# Altium schematic sheet CONNECTORS.SchDoc
size A4; SheetNumber: 15; SheetTotal: 20
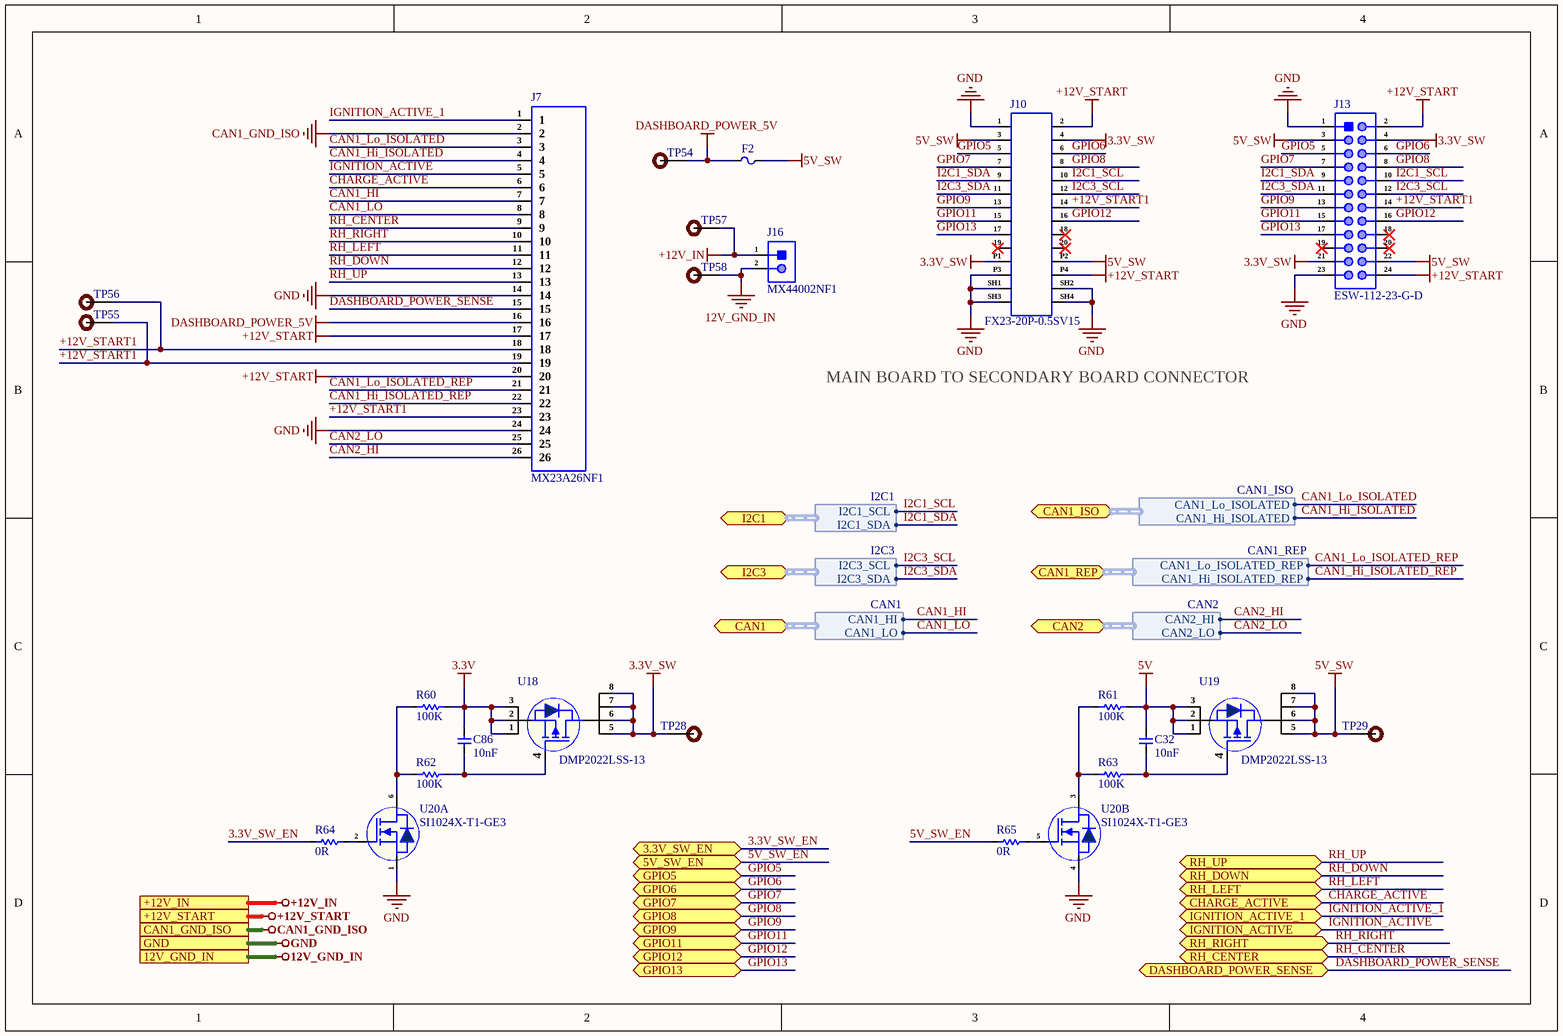
[diagram p0: CONNECTORS.SchDoc]

## Parts
C32  10nF  [Cap-0402]
C86  10nF  [Cap-0402]
F2  0458001.DR  [0458001.DR]  (value not drawn)
J7  MX23A26NF1  [MX23A26NF1]
J10  FX23-20P-0.5SV15  [FX23-20P-0.5SV15]
J13  ESW-112-23-G-D  [ESW-112-23-G-D]
J16  MX44002NF1  [MX44002NF1]
R60  100K  [Res-0402]
R61  100K  [Res-0402]
R62  100K  [Res-0402]
R63  100K  [Res-0402]
R64  0R  [Res-0402]
R65  0R  [Res-0402]
TP28  DNP  [Test-point]  (value not drawn)
TP29  DNP  [Test-point]  (value not drawn)
TP54  DNP  [Test-point]  (value not drawn)
TP55  DNP  [Test-point]  (value not drawn)
TP56  DNP  [Test-point]  (value not drawn)
TP57  DNP  [Test-point]  (value not drawn)
TP58  DNP  [Test-point]  (value not drawn)
U18  DMP2022LSS-13  [SOIC-8]
U19  DMP2022LSS-13  [SOIC-8]
U20  SI1024X-T1-GE3  [SC-89]  (parts A,B of 2)

## Ports
3.3V_SW_EN (bidir, see Top_Sheet[3D], I2C_INTERFACE[2B]), 5V_SW_EN (bidir, see Top_Sheet[3D], I2C_INTERFACE[2B]), 12V_GND_IN (see Top_Sheet[3C], INPUT_SUPPLY_PROTECTION[1D]), +12V_IN (see Top_Sheet[4C], INPUT_SUPPLY_PROTECTION[1C]), +12V_START (see Top_Sheet[4C], DC_DC_CONVERTER[1D], DIGITAL_I-O_O-P[1D], INPUT_SUPPLY_PROTECTION[1C]), CAN1 (bidir, harness CAN1, see Top_Sheet[4C], 03-CAN2_SPI_CAN_CONTROLLER[3D]), CAN1_GND_ISO (see Top_Sheet[3C], 03-CAN2_SPI_CAN_CONTROLLER[1D]), CAN1_ISO (bidir, harness CAN1_ISO, see Top_Sheet[4C], 03-CAN2_SPI_CAN_CONTROLLER[3C]), CAN1_REP (bidir, harness CAN1_REP, see Top_Sheet[4C], 03-CAN2_SPI_CAN_CONTROLLER[3D]), CAN2 (bidir, harness CAN2, see Top_Sheet[4D], CAN2_SPI_CAN_CONTROLLER[2D]), CHARGE_ACTIVE (bidir, see Top_Sheet[3D], I2C_INTERFACE[2B]), DASHBOARD_POWER_SENSE (bidir, see Top_Sheet[3D], DIGITAL_I-O_O-P[1D], GPIO_NC_INTERFACE[3D]), GND (see Top_Sheet[3C], 03-CAN2_SPI_CAN_CONTROLLER[1D], APALIS_POWER_SUPPLY[1D], CAN2_SPI_CAN_CONTROLLER[1D], CODEC_INTERFACE[1D], DC_DC_CONVERTER[1D], DIGITAL_I-O_O-P[1D], ETHERNET_INTERFACE[1D], FUTURE_USE_CONNECTOR[1D], GPIO_NC_INTERFACE[4B], HDMI_INTERFACE[1D], I2C_INTERFACE[1B], INPUT_SUPPLY_PROTECTION[1D], LTE_MODULE[1D], MECHANICAL_FOR_PCB[1D], MICRO_SD_CARD_INTERFACE[1D], Reset_and_SDIO[1D], UART_INTERFACE[1D], USB3.0_INTERFACE[1D]), GPIO5 (bidir, see Top_Sheet[3C], FUTURE_USE_CONNECTOR[2C]), GPIO6 (bidir, see Top_Sheet[3C], FUTURE_USE_CONNECTOR[2C]), GPIO7 (bidir, see Top_Sheet[3C], FUTURE_USE_CONNECTOR[2C]), GPIO8 (bidir, see Top_Sheet[3C], FUTURE_USE_CONNECTOR[2D]), GPIO9 (bidir, see Top_Sheet[3C], FUTURE_USE_CONNECTOR[3C], GPIO_NC_INTERFACE[1D]), GPIO11 (bidir, see Top_Sheet[3C], FUTURE_USE_CONNECTOR[3C], GPIO_NC_INTERFACE[3B]), GPIO12 (bidir, see Top_Sheet[3C], FUTURE_USE_CONNECTOR[3C], GPIO_NC_INTERFACE[3B]), GPIO13 (bidir, see Top_Sheet[3C], FUTURE_USE_CONNECTOR[3C], GPIO_NC_INTERFACE[3B]), I2C1 (bidir, harness I2C1, see Top_Sheet[3D], FUTURE_USE_CONNECTOR[2D], I2C_INTERFACE[4B]), I2C3 (bidir, harness I2C3, see Top_Sheet[3C], CODEC_INTERFACE[3D], I2C_INTERFACE[4B]), IGNITION_ACTIVE (bidir, see Top_Sheet[4D], DIGITAL_I-O_O-P[1D]), IGNITION_ACTIVE_1 (bidir, see Top_Sheet[3D], I2C_INTERFACE[2B]), RH_CENTER (bidir, see Top_Sheet[4C], DIGITAL_I-O_O-P[1D]), RH_DOWN (bidir, see Top_Sheet[4C], DIGITAL_I-O_O-P[1C]), RH_LEFT (bidir, see Top_Sheet[4C], DIGITAL_I-O_O-P[1C]), RH_RIGHT (bidir, see Top_Sheet[4C], DIGITAL_I-O_O-P[1C]), RH_UP (bidir, see Top_Sheet[4C], DIGITAL_I-O_O-P[1C])

## Harnesses
CAN1_ISO: CAN1_Lo_ISOLATED, CAN1_Hi_ISOLATED
CAN1_REP: CAN1_Lo_ISOLATED_REP, CAN1_Hi_ISOLATED_REP
CAN1: CAN1_HI, CAN1_LO
I2C1: I2C1_SCL, I2C1_SDA
I2C3: I2C3_SCL, I2C3_SDA
CAN2: CAN2_HI, CAN2_LO

## Nets
3.3V: C86.2 R60.2 U18.1(S) U18.2(S) U18.3(S)
3.3V_SW: J10.4 J10.P1 J13.4 J13.21 TP28.1 U18.5(D) U18.6(D) U18.7(D) U18.8(D)
5V: C32.2 R61.2 U19.1(S) U19.2(S) U19.3(S)
5V_SW: F2.2 J10.3 J10.P2 J13.3 J13.22 TP29.1 U19.5(D) U19.6(D) U19.7(D) U19.8(D)
12V_GND_IN: J16.2 TP58.1 ; port 12V_GND_IN
+12V_IN: J16.1 TP57.1 ; port +12V_IN
+12V_START: J7.17 J7.20 J10.2 J10.P4 J13.2 J13.24 ; port +12V_START
CAN1_GND_ISO: J7.2 ; port CAN1_GND_ISO
DASHBOARD_POWER_5V: F2.1 J7.16 TP54.1
GND: J7.14 J7.24 J10.1 J10.P3 J10.SH1 J10.SH2 J10.SH3 J10.SH4 J13.1 J13.23 U20.1(S1) U20.4(S2) ; port GND
3.3V_SW_EN: R64.1 ; port 3.3V_SW_EN
5V_SW_EN: R65.1 ; port 5V_SW_EN
+12V_START1: J7.18 J7.19 J7.23 J10.14 J13.14 TP55.1 TP56.1
CAN1_HI: J7.7 ; port CAN1.CAN1_HI
CAN1_Hi_ISOLATED: J7.4 ; port CAN1_ISO.CAN1_Hi_ISOLATED
CAN1_Hi_ISOLATED_REP: J7.22 ; port CAN1_REP.CAN1_Hi_ISOLATED_REP
CAN1_LO: J7.8 ; port CAN1.CAN1_LO
CAN1_Lo_ISOLATED: J7.3 ; port CAN1_ISO.CAN1_Lo_ISOLATED
CAN1_Lo_ISOLATED_REP: J7.21 ; port CAN1_REP.CAN1_Lo_ISOLATED_REP
CAN2_HI: J7.26 ; port CAN2.CAN2_HI
CAN2_LO: J7.25 ; port CAN2.CAN2_LO
CHARGE_ACTIVE: J7.6 ; port CHARGE_ACTIVE
DASHBOARD_POWER_SENSE: J7.15 ; port DASHBOARD_POWER_SENSE
GPIO5: J10.5 J13.5 ; port GPIO5
GPIO6: J10.6 J13.6 ; port GPIO6
GPIO7: J10.7 J13.7 ; port GPIO7
GPIO8: J10.8 J13.8 ; port GPIO8
GPIO9: J10.13 J13.13 ; port GPIO9
GPIO11: J10.15 J13.15 ; port GPIO11
GPIO12: J10.16 J13.16 ; port GPIO12
GPIO13: J10.17 J13.17 ; port GPIO13
I2C1_SCL: J10.10 J13.10 ; port I2C1.I2C1_SCL
I2C1_SDA: J10.9 J13.9 ; port I2C1.I2C1_SDA
I2C3_SCL: J10.12 J13.12 ; port I2C3.I2C3_SCL
I2C3_SDA: J10.11 J13.11 ; port I2C3.I2C3_SDA
IGNITION_ACTIVE: J7.5 ; port IGNITION_ACTIVE
IGNITION_ACTIVE_1: J7.1 ; port IGNITION_ACTIVE_1
RH_CENTER: J7.9 ; port RH_CENTER
RH_DOWN: J7.12 ; port RH_DOWN
RH_LEFT: J7.11 ; port RH_LEFT
RH_RIGHT: J7.10 ; port RH_RIGHT
RH_UP: J7.13 ; port RH_UP
NetC32_1: C32.1 R63.2 U19.4(G)
NetC86_1: C86.1 R62.2 U18.4(G)
NetR60_1: R60.1 R62.1 U20.6(D1)
NetR61_1: R61.1 R63.1 U20.3(D2)
NetR64_2: R64.2 U20.2(G1)
NetR65_2: R65.2 U20.5(G2)

Not connected (* = marked no-connect by the designer): J10 18* 19* 20*; J13 18* 19* 20*

## Notes on the sheet
- MAIN BOARD TO SECONDARY BOARD CONNECTOR

## Library data of the parts
C32 C86 = C0402C103K5RAC7411: CAP CER 10000PF 50V X7R 0402; Manufacturer: KEMET; Dielectric Material: Ceramic; Tolerance: 10%; Item Type: Capacitor; Supplier: Mouser; Supplier Part Number: 80-C0402C103K5R7411; Manufacturer Part Number: C0402C103K5RAC7411; RoHS: Yes; Category: Ceramic Capacitors; Stock: 440672; Pricing: 1=0.1, 10=0.017, 50=0.017, 100=0.009, 1000=0.005, 10000=0.004 (USD); Mounting Technology: Surface Mount; Case/Package: 0402; Min Operating Temperature: -55°C; Max Operating Temperature: 125°C; Value: 10nF; Dielectric: X7R; Voltage Rating (DC): 50V; Construction: Flat; Length: 1mm; Height: 0.5mm; Depth: 0.5mm; Radiation Hardening: No; RoHS Compliant: Yes; ComponentLink1URL: http://capacitoredge.kemet.com/capedge2/DataSheet?pn=C0402C103K5RAC7411&src-supplier=Avnet; ComponentLink1Description: http://capacitoredge.kemet.com/capedge2/DataSheet?pn=C0402C103K5RAC7411&src-supplier=Avnet
F2 = 0458001.DR: FUSE BRD MNT 1A 48VAC 75VDC 1206; Manufacturer: Littelfuse; Supplier: Rs; Supplier Part Number: 1740295; Manufacturer Part Number: 0458001.DR; RoHS: Yes; Category: Fuses; Stock: 140; Pricing: 1=0.76003, 10=0.73892, 25=0.71895, 50=0.70003 (GBP); ComponentLink1URL: https://datasheet.ciiva.com/299/littelfuse-fuse-458-series-299789.pdf?src-supplier=Digi-Key; ComponentLink1Description: https://datasheet.ciiva.com/299/littelfuse-fuse-458-series-299789.pdf?src-supplier=Digi-Key; ComponentLink2URL: https://datasheet.ciiva.com/299/littelfuse-fuse-458-series-299790.pdf?src-supplier=Digi-Key; ComponentLink2Description: https://datasheet.ciiva.com/299/littelfuse-fuse-458-series-299790.pdf?src-supplier=Digi-Key; ComponentLink3URL: https://datasheet.ciiva.com/299/littelfuse-fuse-458-series-299791.pdf?src-supplier=Digi-Key; ComponentLink3Description: https://datasheet.ciiva.com/299/littelfuse-fuse-458-series-299791.pdf?src-supplier=Digi-Key; ComponentLink4URL: https://datasheet.ciiva.com/1730/337915-1730543.pdf?src-supplier=Newark; ComponentLink4Description: https://datasheet.ciiva.com/1730/337915-1730543.pdf?src-supplier=Newark; ComponentLink5URL: https://datasheet.ciiva.com/7991/337915-7991902.pdf?src-supplier=Element14; ComponentLink5Description: https://datasheet.ciiva.com/7991/337915-7991902.pdf?src-supplier=Element14; ComponentLink6URL: https://datasheet.ciiva.com/1549/337915-1549634.pdf?src-supplier=Element14; ComponentLink6Description: https://datasheet.ciiva.com/1549/337915-1549634.pdf?src-supplier=Element14; Item Type: Fuse
J7 = MX23A26NF1: CONN HEADER R/A 26POS 2.5MM; Manufacturer: JAE Electronics; Current Rating: 3A; Gender: Male; Connector Type: Header,Power,Rectangular; Number of Positions: 26; Insulation Resistance: 100MR; Wire Gauge (Max): 16AWG; Wire Gauge (Min): 22AWG; Outside Diameter: 2.2mm; Ratings: Waterproof; Supplier: Rs; Supplier Part Number: 435774; Manufacturer Part Number: MX23A26NF1; RoHS: Yes; Category: Automotive Connectors; Stock: 42; Pricing: 1=7.15, 10=6.83, 20=6.5 (GBP); Mounting Technology: Through Hole; Contact Material: Copper Alloy,Brass,Copper; Contact Plating: Tin; Color: Black; Material: PBT,Polybutylene; Contact Shape: Square; Contact Finish - Mating: TIN; Insulation Material: PBT; Insulation Color: Black; Min Operating Temperature: -40°C; Max Operating Temperature: 125°C; Number of Rows: 2; Packaging: Bulk; Package Quantity: 160; Termination: Solder; Number of Contacts: 26; Orientation: Right Angle; Features: WATERPROOF; Series: MX23A; Contact Type: Male Pin; Fastening Type: Latch; Length: 44mm; Pitch: 2.5mm; Reach SVHC Compliant: No; RoHS Compliant: Yes; ComponentLink1URL: https://datasheet.ciiva.com/11748/0900766b80fc1621-11748856.pdf?src-supplier=Rs; ComponentLink1Description: https://datasheet.ciiva.com/11748/0900766b80fc1621-11748856.pdf?src-supplier=Rs; ComponentLink2URL: https://datasheet.ciiva.com/7621/611555-7621573.pdf?src-supplier=Element14; ComponentLink2Description: https://datasheet.ciiva.com/7621/611555-7621573.pdf?src-supplier=Element14; ComponentLink3URL: https://datasheet.ciiva.com/726/transportation-pg-v2-2-726957.pdf?src-supplier=Digi-Key; ComponentLink3Description: https://datasheet.ciiva.com/726/transportation-pg-v2-2-726957.pdf?src-supplier=Digi-Key
J10 = FX23-20P-0.5SV15: CONN HDR 20POS SMD GOLD; Manufacturer: Hirose; Supplier: Future Electronics; Supplier Part Number: 4093766; Manufacturer Part Number: FX23-20P-0.5SV15; RoHS: Yes; Category: Board to Board Connectors; Stock: 1092; Pricing: 84=2.41, 168=2.36, 252=2.34, 420=2.31, 840=2.25 (USD); ComponentLink1URL: https://www.hirose.com/product/en/download_file/key_name/FX23-20P-0.5SV15/category/Specification%20Sheet/doc_file_id/88145/?file_category_id=9&item_id=05733001000&is_series=&src-supplier=Digi-Key; ComponentLink1Description: https://www.hirose.com/product/en/download_file/key_name/FX23-20P-0.5SV15/category/Specification%20Sheet/doc_file_id/88145/?file_category_id=9&item_id=05733001000&is_series=&src-supplier=Digi-Key; ComponentLink2URL: https://datasheet.octopart.com/FX23-20P-0.5SV15-Hirose-datasheet-155938459.pdf?src-supplier=Sager+Electronics; ComponentLink2Description: https://datasheet.octopart.com/FX23-20P-0.5SV15-Hirose-datasheet-155938459.pdf?src-supplier=Sager+Electronics
J13 = ESW-112-23-G-D: CONN SOCKET 24POS 0.1 GOLD PCB; Manufacturer: Samtec; Supplier: Digi-Key; Supplier Part Number: ESW-112-23-G-D-ND; Manufacturer Part Number: ESW-112-23-G-D; RoHS: Yes; Category: Connectors; Stock: 108; Pricing: 1=7.81, 10=7.057, 100=6.1792, 500=5.20352, 1000=4.55308 (USD); ComponentLink1URL: https://datasheet.ciiva.com/15195/getdatasheetpartid-567182-15195174.pdf?src-supplier=Verical; ComponentLink1Description: https://datasheet.ciiva.com/15195/getdatasheetpartid-567182-15195174.pdf?src-supplier=Verical
J16 = MX44002NF1: CONN HEADER BRD EDGE 2POS 3.5MM; Manufacturer: JAE Electronics; Supplier: Mouser; Supplier Part Number: 656-MX44002NF1; Manufacturer Part Number: MX44002NF1; RoHS: Yes; Category: Automotive Connectors; Stock: 525; Pricing: 1=5.41, 10=4.37, 50=4.37, 100=4.33, 1000=3.14, 10000=2.92 (USD); ComponentLink1URL: https://datasheet.ciiva.com/13878/sj107054-48235-13878974.pdf?src-supplier=Mouser; ComponentLink1Description: https://datasheet.ciiva.com/13878/sj107054-48235-13878974.pdf?src-supplier=Mouser; ComponentLink2URL: https://datasheet.ciiva.com/11754/0900766b80fb029b-11754147.pdf?src-supplier=Rs; ComponentLink2Description: https://datasheet.ciiva.com/11754/0900766b80fb029b-11754147.pdf?src-supplier=Rs; ComponentLink3URL: https://datasheet.ciiva.com/7621/1448958-7621599.pdf?src-supplier=Element14; ComponentLink3Description: https://datasheet.ciiva.com/7621/1448958-7621599.pdf?src-supplier=Element14; ComponentLink4URL: https://datasheet.ciiva.com/733/transportation-pg-v2-2-733517.pdf?src-supplier=Digi-Key; ComponentLink4Description: https://datasheet.ciiva.com/733/transportation-pg-v2-2-733517.pdf?src-supplier=Digi-Key; ComponentLink5URL: https://datasheet.ciiva.com/29364/l0132s0193blm18p-29364421.pdf?src-supplier=Digi-Key; ComponentLink5Description: https://datasheet.ciiva.com/29364/l0132s0193blm18p-29364421.pdf?src-supplier=Digi-Key; ComponentLink6URL: https://datasheet.ciiva.com/29364/l0132s0193blm18p-29364423.pdf?src-supplier=Digi-Key; ComponentLink6Description: https://datasheet.ciiva.com/29364/l0132s0193blm18p-29364423.pdf?src-supplier=Digi-Key; ComponentLink7URL: https://datasheet.ciiva.com/29364/l0132s0193blm18p-29364425.pdf?src-supplier=Digi-Key; ComponentLink7Description: https://datasheet.ciiva.com/29364/l0132s0193blm18p-29364425.pdf?src-supplier=Digi-Key
R60-R63 = RC0402JR-07100KL: RES 100K OHM 5% 1/16W 0402; Manufacturer: Yageo; Voltage Rating: 50V; Value: 100kR; Power Rating: 62.5mW; Temperature Coefficient: 100ppm/°C; Max Power Dissipation: 63mW; Supplier: Future Electronics; Supplier Part Number: 4246625; Manufacturer Part Number: RC0402JR-07100KL; RoHS: Yes; Category: Chip SMD Resistors; Stock: 7540000; Pricing: 10000=0.0013, 100000=0.0008, 200000=0.0013, 400000=0.0008, 750000=0.0012, 1250000=0.0007, 2500000=0.0012, 4000000=0.0007, 10000000=0.0011 (USD); Case/Package: 0402; Case Code (Metric): 1005; Case Code (Imperial): 0402; Min Operating Temperature: -55°C; Max Operating Temperature: 155°C; Packaging: Tape and Reel; Termination: SMD/SMT; Tolerance: 5%; Series: RC; Resistor Type: Thick Film; Number of Terminations: 2; Features: Moisture Resistant; Resistance Tolerance: 5%; Construction: Rectangular; Length: 1mm; Depth: 0.5mm; Lead Free: Lead Free; Reach SVHC Compliant: Unknown; RoHS Compliant: Yes; Military Standard: Not; ComponentLink1URL: https://datasheet.ciiva.com/2491/pyu-r-int-thick-7-2491208.pdf?src-supplier=Digi-Key; ComponentLink1Description: https://datasheet.ciiva.com/2491/pyu-r-int-thick-7-2491208.pdf?src-supplier=Digi-Key; ComponentLink2URL: https://datasheet.ciiva.com/46394/1018594-46394941.pdf?src-supplier=Element14; ComponentLink2Description: https://datasheet.ciiva.com/46394/1018594-46394941.pdf?src-supplier=Element14; ComponentLink3URL: https://datasheet.ciiva.com/2491/pyu-r-int-thick-7-2491209.pdf?src-supplier=Digi-Key; ComponentLink3Description: https://datasheet.ciiva.com/2491/pyu-r-int-thick-7-2491209.pdf?src-supplier=Digi-Key; ComponentLink4URL: https://datasheet.ciiva.com/2491/pyu-r-int-thick-7-2491207.pdf?src-supplier=Digi-Key; ComponentLink4Description: https://datasheet.ciiva.com/2491/pyu-r-int-thick-7-2491207.pdf?src-supplier=Digi-Key; ComponentLink5URL: https://datasheet.ciiva.com/12668/pyu-rc0402-51-rohs-l-6-r-12668218.pdf?src-supplier=Mouser; ComponentLink5Description: https://datasheet.ciiva.com/12668/pyu-rc0402-51-rohs-l-6-r-12668218.pdf?src-supplier=Mouser
R64 R65 = ERJ-2GE0R00X: RES SMD 0 OHM JUMPER 1/10W 0402; Manufacturer: Panasonic; Value: 0mR; Power Rating: 100mW; Voltage Rating: 50V; Tolerance: 5%; Temperature Coefficient: 600ppm/°C; Supplier: Mouser; Supplier Part Number: 667-ERJ-2GE0R00X; Manufacturer Part Number: ERJ-2GE0R00X; RoHS: Yes; Category: Chip SMD Resistors; Stock: 10959876; Pricing: 1=0.1, 10=0.013, 50=0.013, 100=0.006, 1000=0.004, 10000=0.003 (USD); Mounting Technology: Surface Mount; Case/Package: 0402; Pins: 2NUMBER; Contact Plating: Tin; Case Code (Metric): 1005; Case Code (Imperial): 0402; Min Operating Temperature: -55°C; Max Operating Temperature: 155°C; Resistor Type: Thick Film; Packaging: Cut Tape; Package Quantity: 10000; Number of Terminations: 2; Termination: SMD/SMT; Max Power Dissipation: 100mW; Voltage Rating (DC): 50V; Features: Automotive AEC-Q200; Series: ERJ; Construction: Rectangular; Technology: THICK FILM; Length: 1mm; Width: 0.5mm; Height: 0.35mm; Depth: 0.5mm; Ratings: AEC-Q200; Radiation Hardening: No; Reach SVHC Compliant: No; Military Standard: Not; Lead Free: Lead Free; RoHS Compliant: Yes; ComponentLink1URL: https://datasheet.ciiva.com/11821/0900766b80f806dd-11821176.pdf?src-supplier=Rs; ComponentLink1Description: https://datasheet.ciiva.com/11821/0900766b80f806dd-11821176.pdf?src-supplier=Rs; ComponentLink2URL: https://datasheet.ciiva.com/46389/1678796-46389518.pdf?src-supplier=Element14; ComponentLink2Description: https://datasheet.ciiva.com/46389/1678796-46389518.pdf?src-supplier=Element14; ComponentLink3URL: https://datasheet.ciiva.com/28695/1678796-28695758.pdf?src-supplier=Element14; ComponentLink3Description: https://datasheet.ciiva.com/28695/1678796-28695758.pdf?src-supplier=Element14; ComponentLink4URL: https://datasheet.ciiva.com/16778/70260739-16778335.pdf?src-supplier=Allied+Electronics; ComponentLink4Description: https://datasheet.ciiva.com/16778/70260739-16778335.pdf?src-supplier=Allied+Electronics; ComponentLink5URL: https://datasheet.ciiva.com/48531/aoa0000ce1-48531077.pdf?src-supplier=Avnet; ComponentLink5Description: https://datasheet.ciiva.com/48531/aoa0000ce1-48531077.pdf?src-supplier=Avnet; ComponentLink6URL: https://datasheet.ciiva.com/30097/4aoa0000ce1-30097116.pdf?src-supplier=Onlinecomponents.com; ComponentLink6Description: https://datasheet.ciiva.com/30097/4aoa0000ce1-30097116.pdf?src-supplier=Onlinecomponents.com; ComponentLink7URL: https://datasheet.ciiva.com/43460/1678796-43460347.pdf?src-supplier=Farnell; ComponentLink7Description: https://datasheet.ciiva.com/43460/1678796-43460347.pdf?src-supplier=Farnell; ComponentLink8URL: https://datasheet.ciiva.com/5959/1678796-5959692.pdf?src-supplier=Farnell; ComponentLink8Description: https://datasheet.ciiva.com/5959/1678796-5959692.pdf?src-supplier=Farnell; ComponentLink9URL: https://datasheet.ciiva.com/16783/70260739-16783734.pdf?src-supplier=Allied+Electronics; ComponentLink9Description: https://datasheet.ciiva.com/16783/70260739-16783734.pdf?src-supplier=Allied+Electronics
TP28 TP29 TP54-TP58 = TEST POINT: Test Point ON; Item Type: TEST POINT
U18 U19 = DMP2022LSS-13: MOSFET P-CH 20V 10A 8SOP; Manufacturer: Diodes; Supplier: Avnet; Supplier Part Number: DMP2022LSS-13; Manufacturer Part Number: DMP2022LSS-13; RoHS: Yes; Category: MOSFETs; Stock: 37500; Pricing: 2500=0.18459, 5000=0.17798, 10000=0.17262, 15000=0.16758, 20000=0.16128, 25000=0.15876, 250000=0.15624 (USD); ComponentLink1URL: https://datasheet.ciiva.com/946/ds31373-946629.pdf?src-supplier=Digi-Key; ComponentLink1Description: https://datasheet.ciiva.com/946/ds31373-946629.pdf?src-supplier=Digi-Key; ComponentLink2URL: https://datasheet.ciiva.com/946/ds31373-946629.pdf?src-supplier=Avnet; ComponentLink2Description: https://datasheet.ciiva.com/946/ds31373-946629.pdf?src-supplier=Avnet; ComponentLink3URL: https://datasheet.ciiva.com/13045/ds31373-89644-13045812.pdf?src-supplier=Mouser; ComponentLink3Description: https://datasheet.ciiva.com/13045/ds31373-89644-13045812.pdf?src-supplier=Mouser; ComponentLink4URL: https://datasheet.ciiva.com/946/ds31373-946630.pdf?src-supplier=Digi-Key; ComponentLink4Description: https://datasheet.ciiva.com/946/ds31373-946630.pdf?src-supplier=Digi-Key; ComponentLink5URL: https://datasheet.ciiva.com/946/ds31373-946631.pdf?src-supplier=Digi-Key; ComponentLink5Description: https://datasheet.ciiva.com/946/ds31373-946631.pdf?src-supplier=Digi-Key; ComponentLink6URL: https://datasheet.ciiva.com/11174/ds31373-11174902.pdf?src-supplier=Avnet; ComponentLink6Description: https://datasheet.ciiva.com/11174/ds31373-11174902.pdf?src-supplier=Avnet
U20 = SI1024X-T1-GE3: MOSFET 2N-CH 20V 0.485A SC89-6; Manufacturer: Vishay Siliconix; Supplier: Mouser; Supplier Part Number: 781-SI1024X-T1-GE3; Manufacturer Part Number: SI1024X-T1-GE3; RoHS: Yes; Category: MOSFETs; Stock: 297800; Pricing: 1=0.52, 10=0.442, 50=0.442, 100=0.333, 1000=0.206, 10000=0.163 (USD); ComponentLink1URL: https://datasheet.ciiva.com/1253/71170-1253313.pdf?src-supplier=Newark; ComponentLink1Description: https://datasheet.ciiva.com/1253/71170-1253313.pdf?src-supplier=Newark; ComponentLink2URL: https://datasheet.ciiva.com/6388/71170-6388105.pdf?src-supplier=Digi-Key; ComponentLink2Description: https://datasheet.ciiva.com/6388/71170-6388105.pdf?src-supplier=Digi-Key; ComponentLink3URL: https://datasheet.ciiva.com/6388/71170-6388154.pdf?src-supplier=Digi-Key; ComponentLink3Description: https://datasheet.ciiva.com/6388/71170-6388154.pdf?src-supplier=Digi-Key; ComponentLink4URL: https://datasheet.ciiva.com/6388/71170-6388155.pdf?src-supplier=Digi-Key; ComponentLink4Description: https://datasheet.ciiva.com/6388/71170-6388155.pdf?src-supplier=Digi-Key; ComponentLink5URL: https://datasheet.ciiva.com/11161/71170-11161434.pdf?src-supplier=Avnet; ComponentLink5Description: https://datasheet.ciiva.com/11161/71170-11161434.pdf?src-supplier=Avnet